# EAGLE schematic waveform (EAGLE 9.6.2)
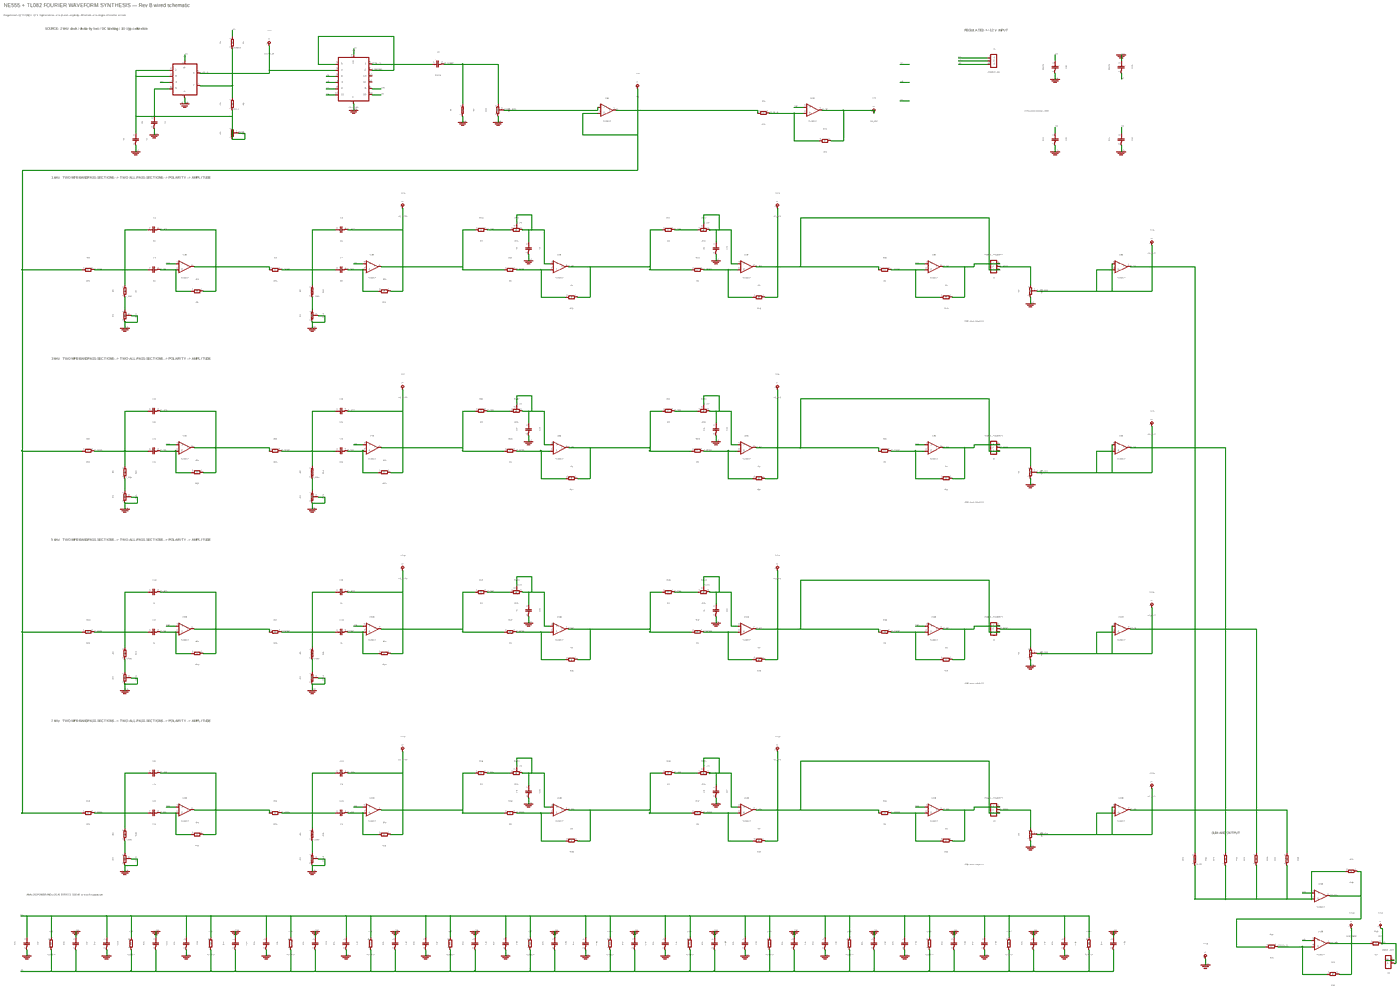
[diagram p0: schematic, sheet 1, overview]
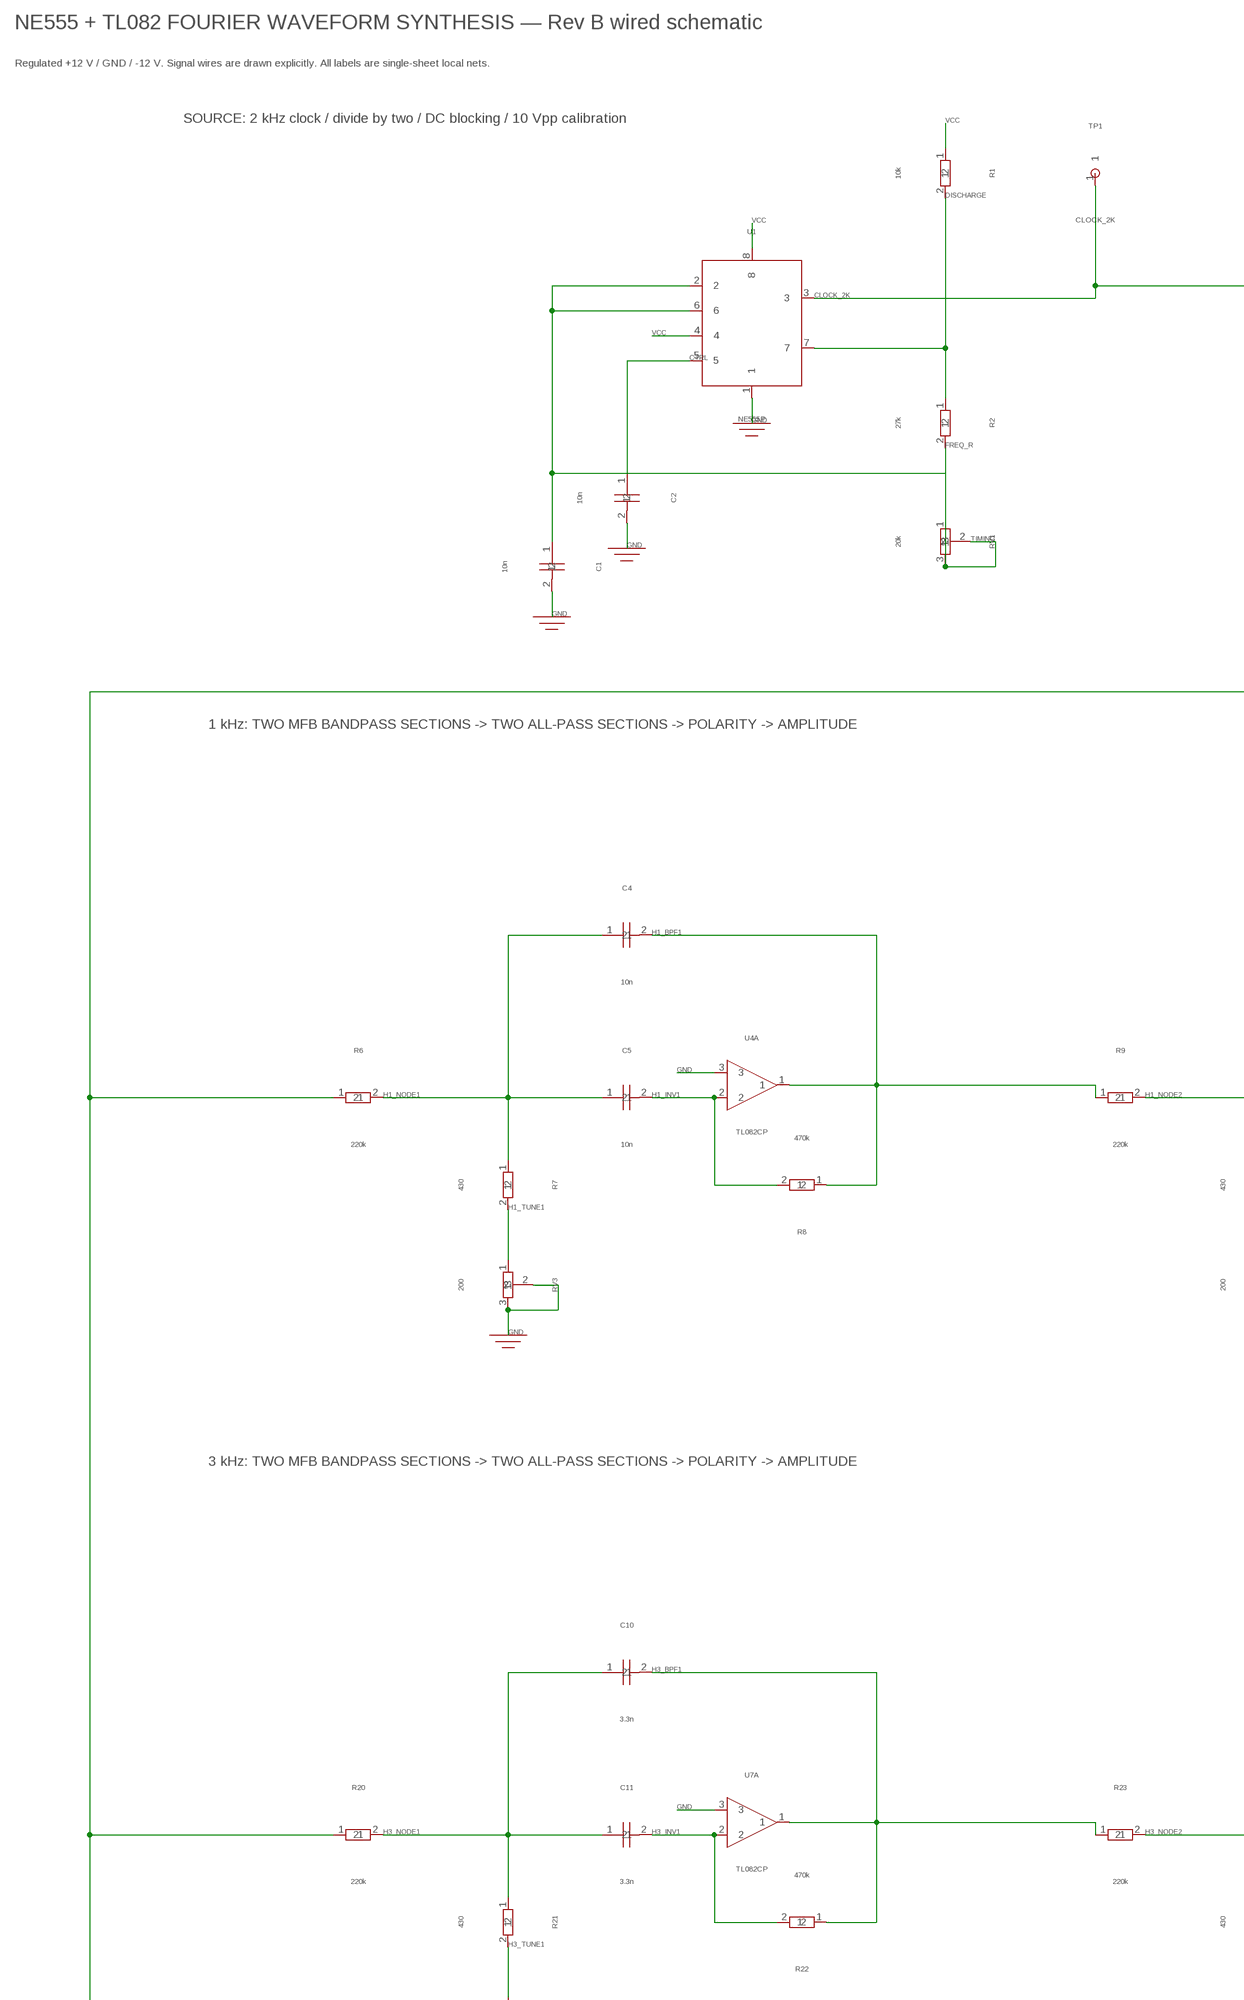
[diagram p1: schematic, sheet 1, part 1 of 8]
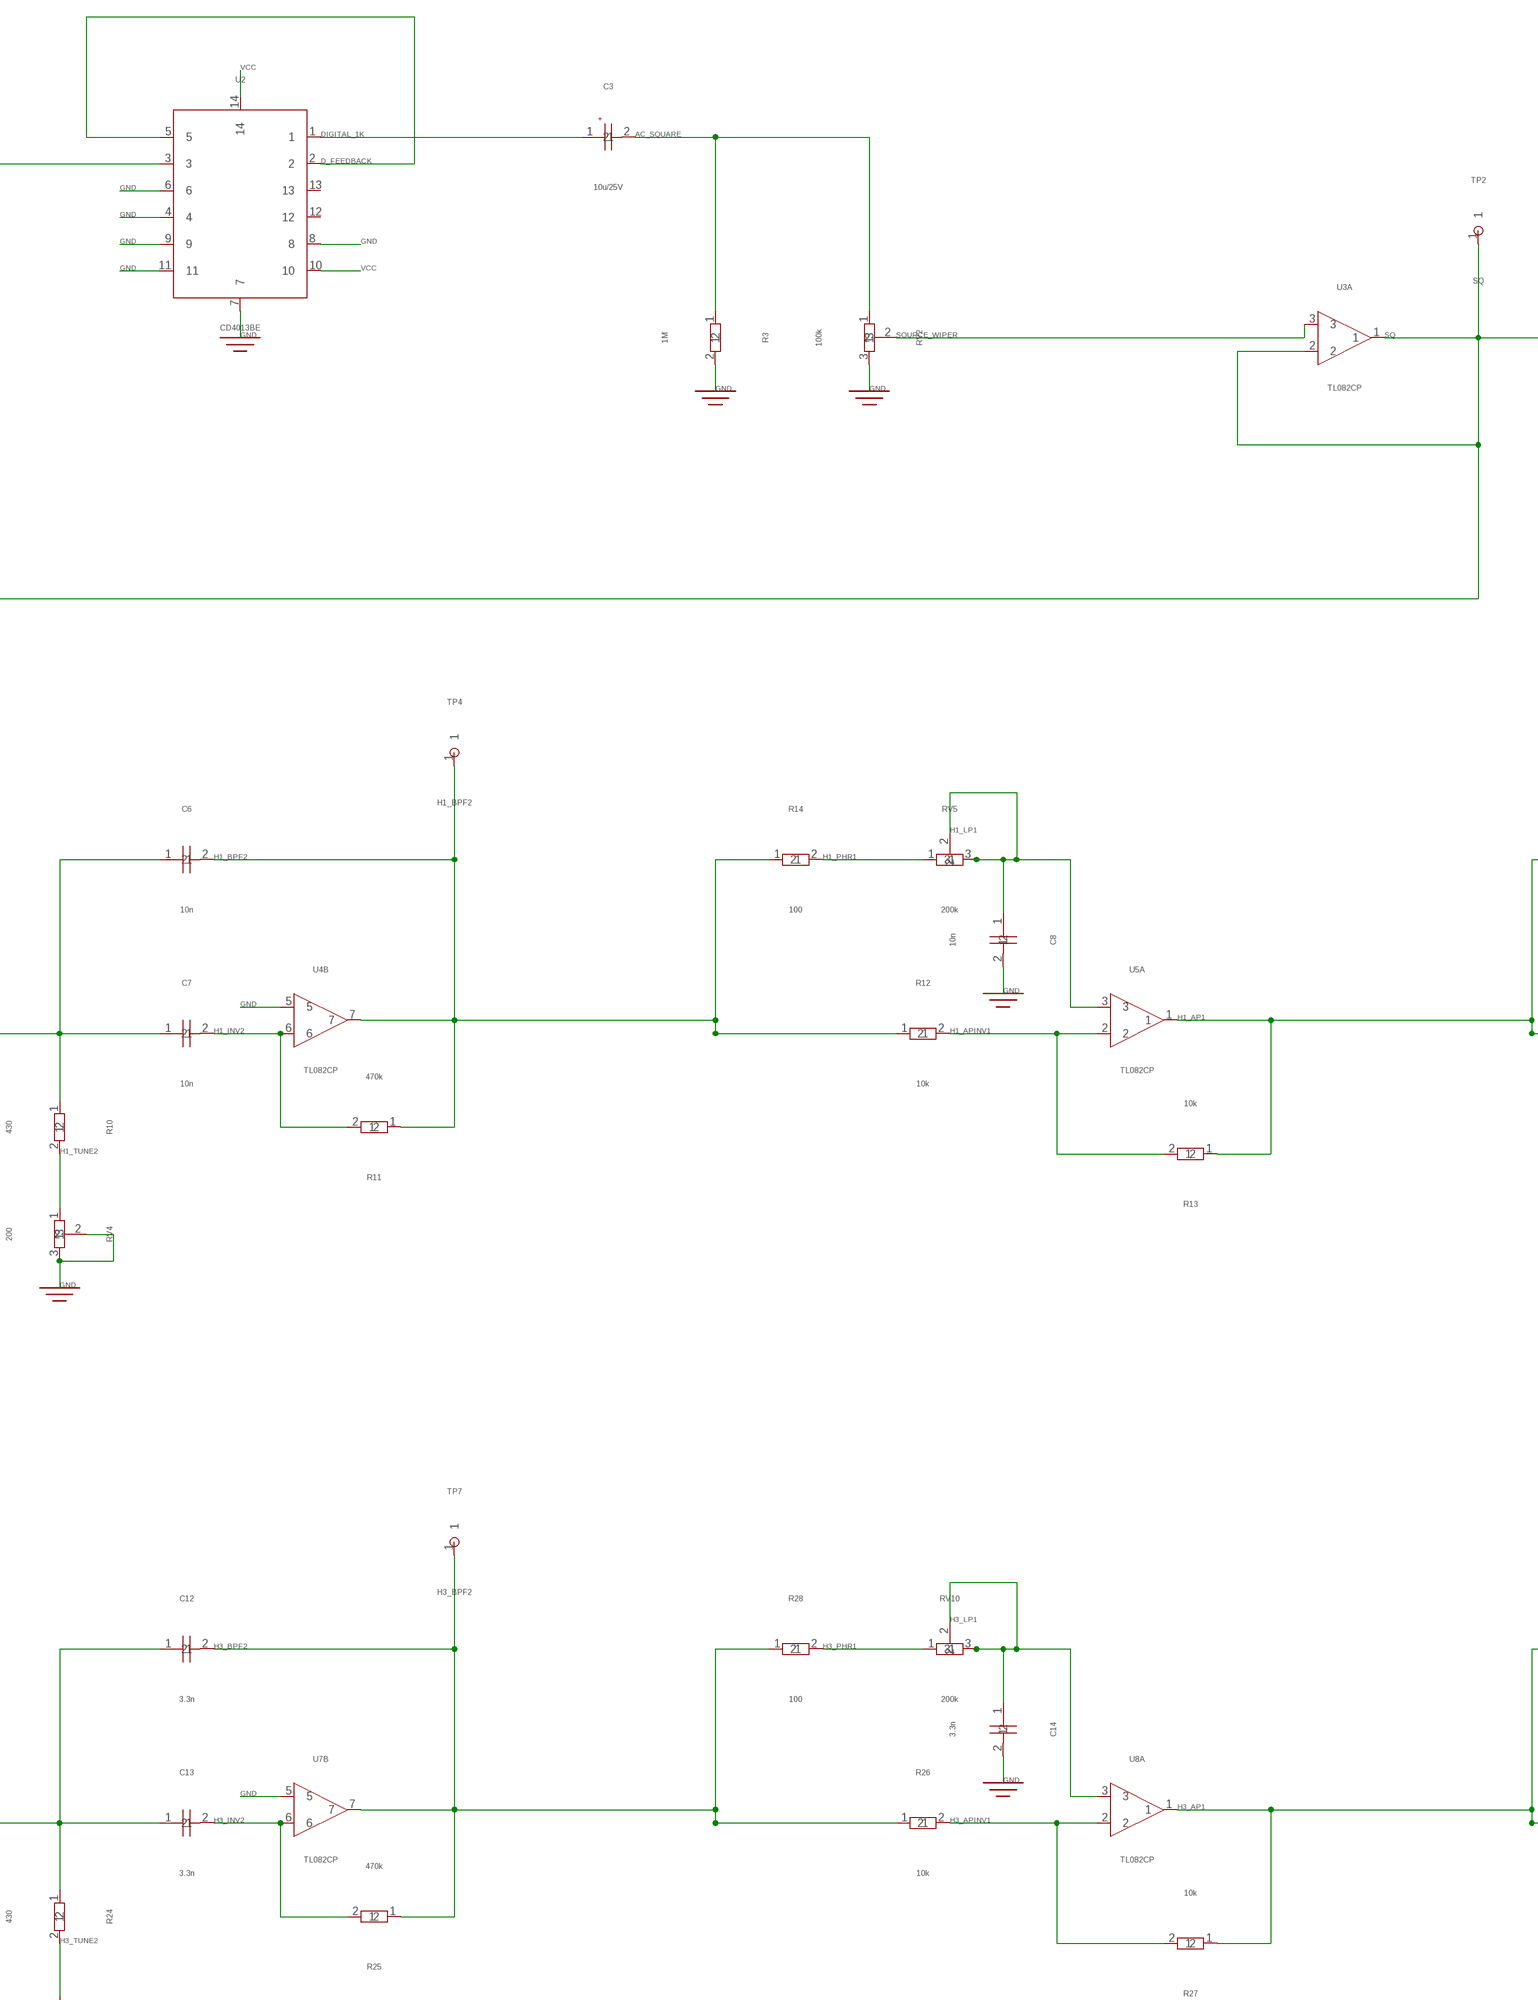
[diagram p2: schematic, sheet 1, part 2 of 8]
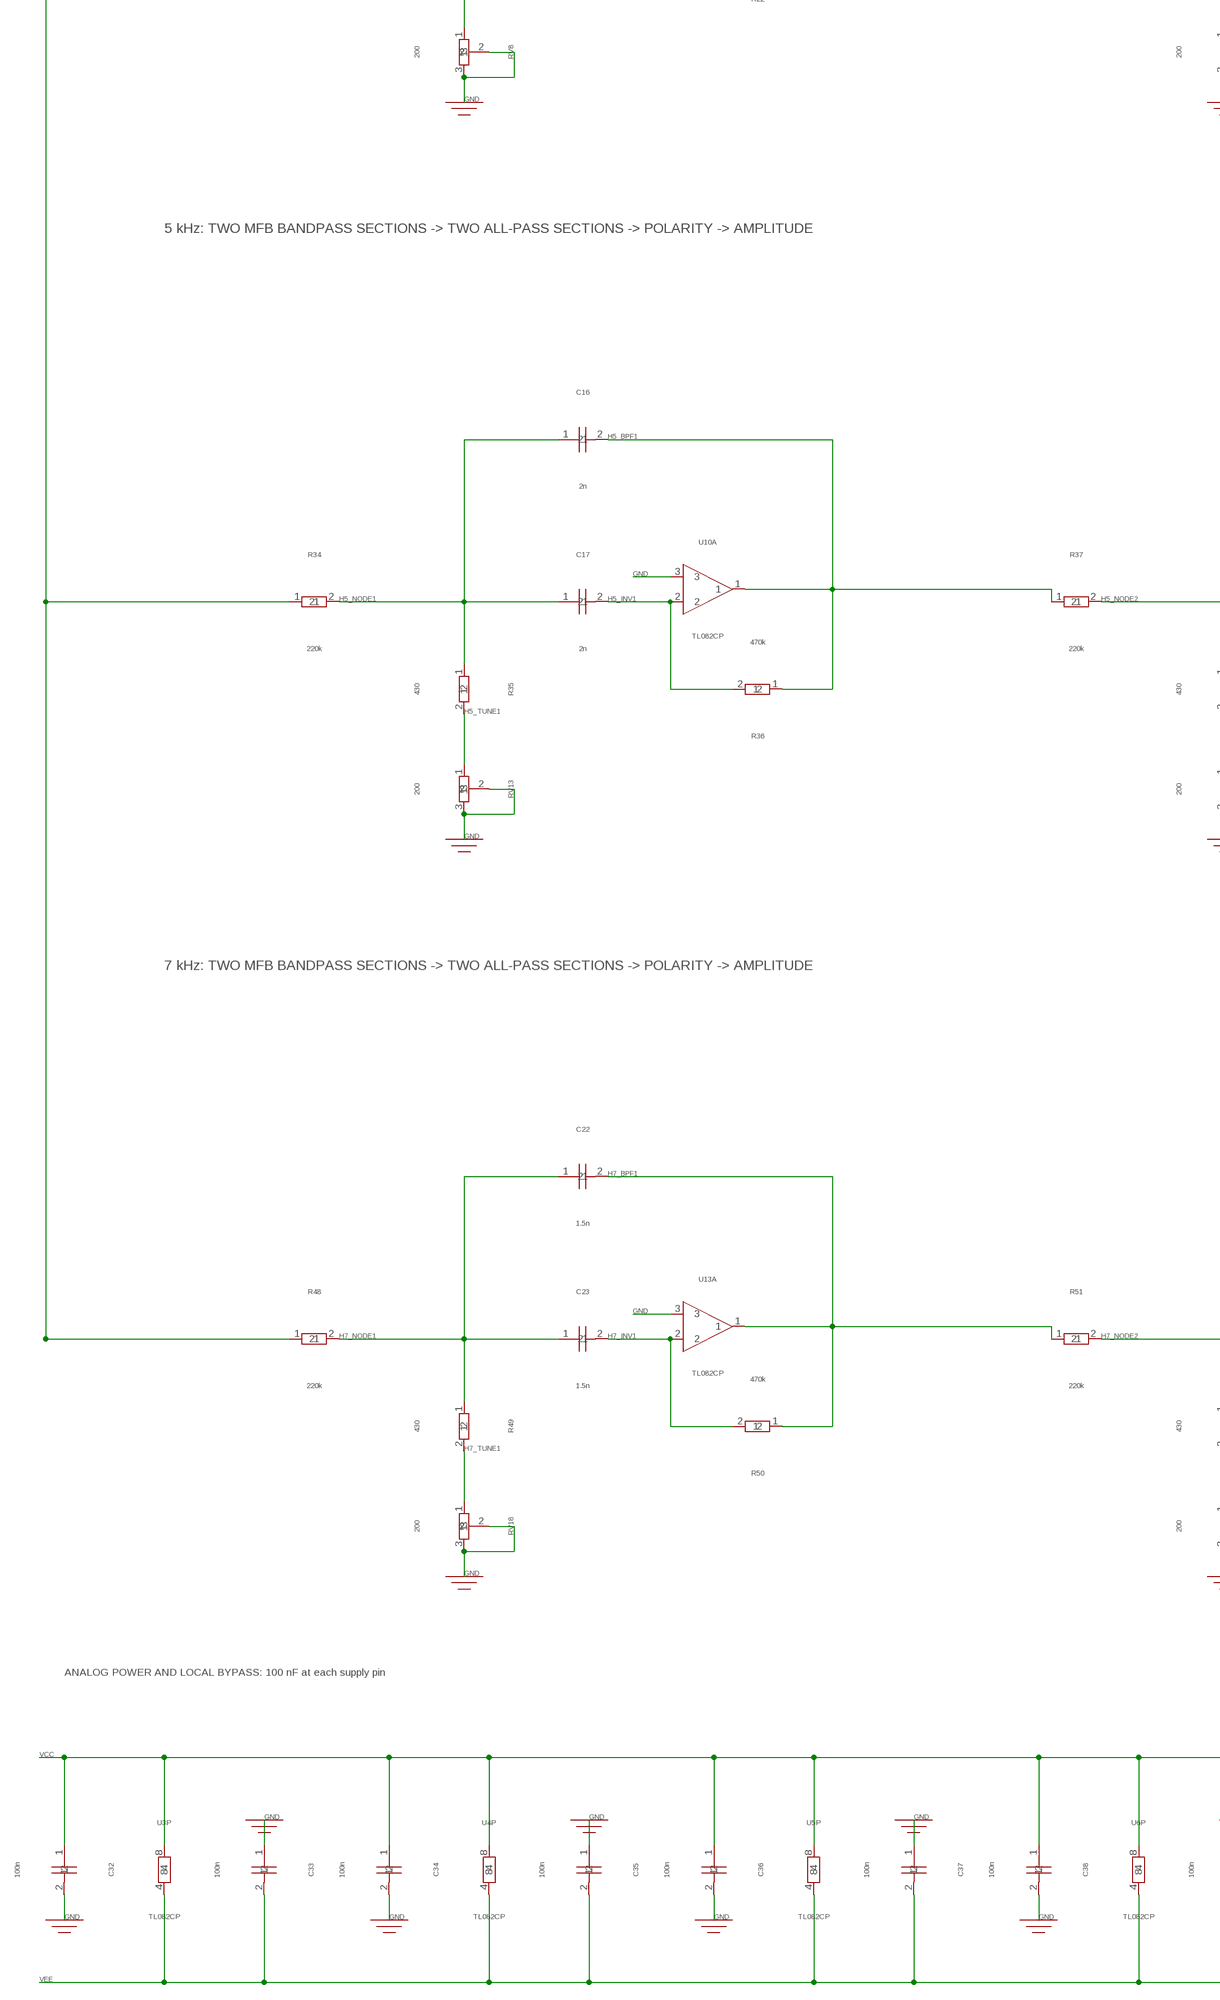
[diagram p3: schematic, sheet 1, part 3 of 8]
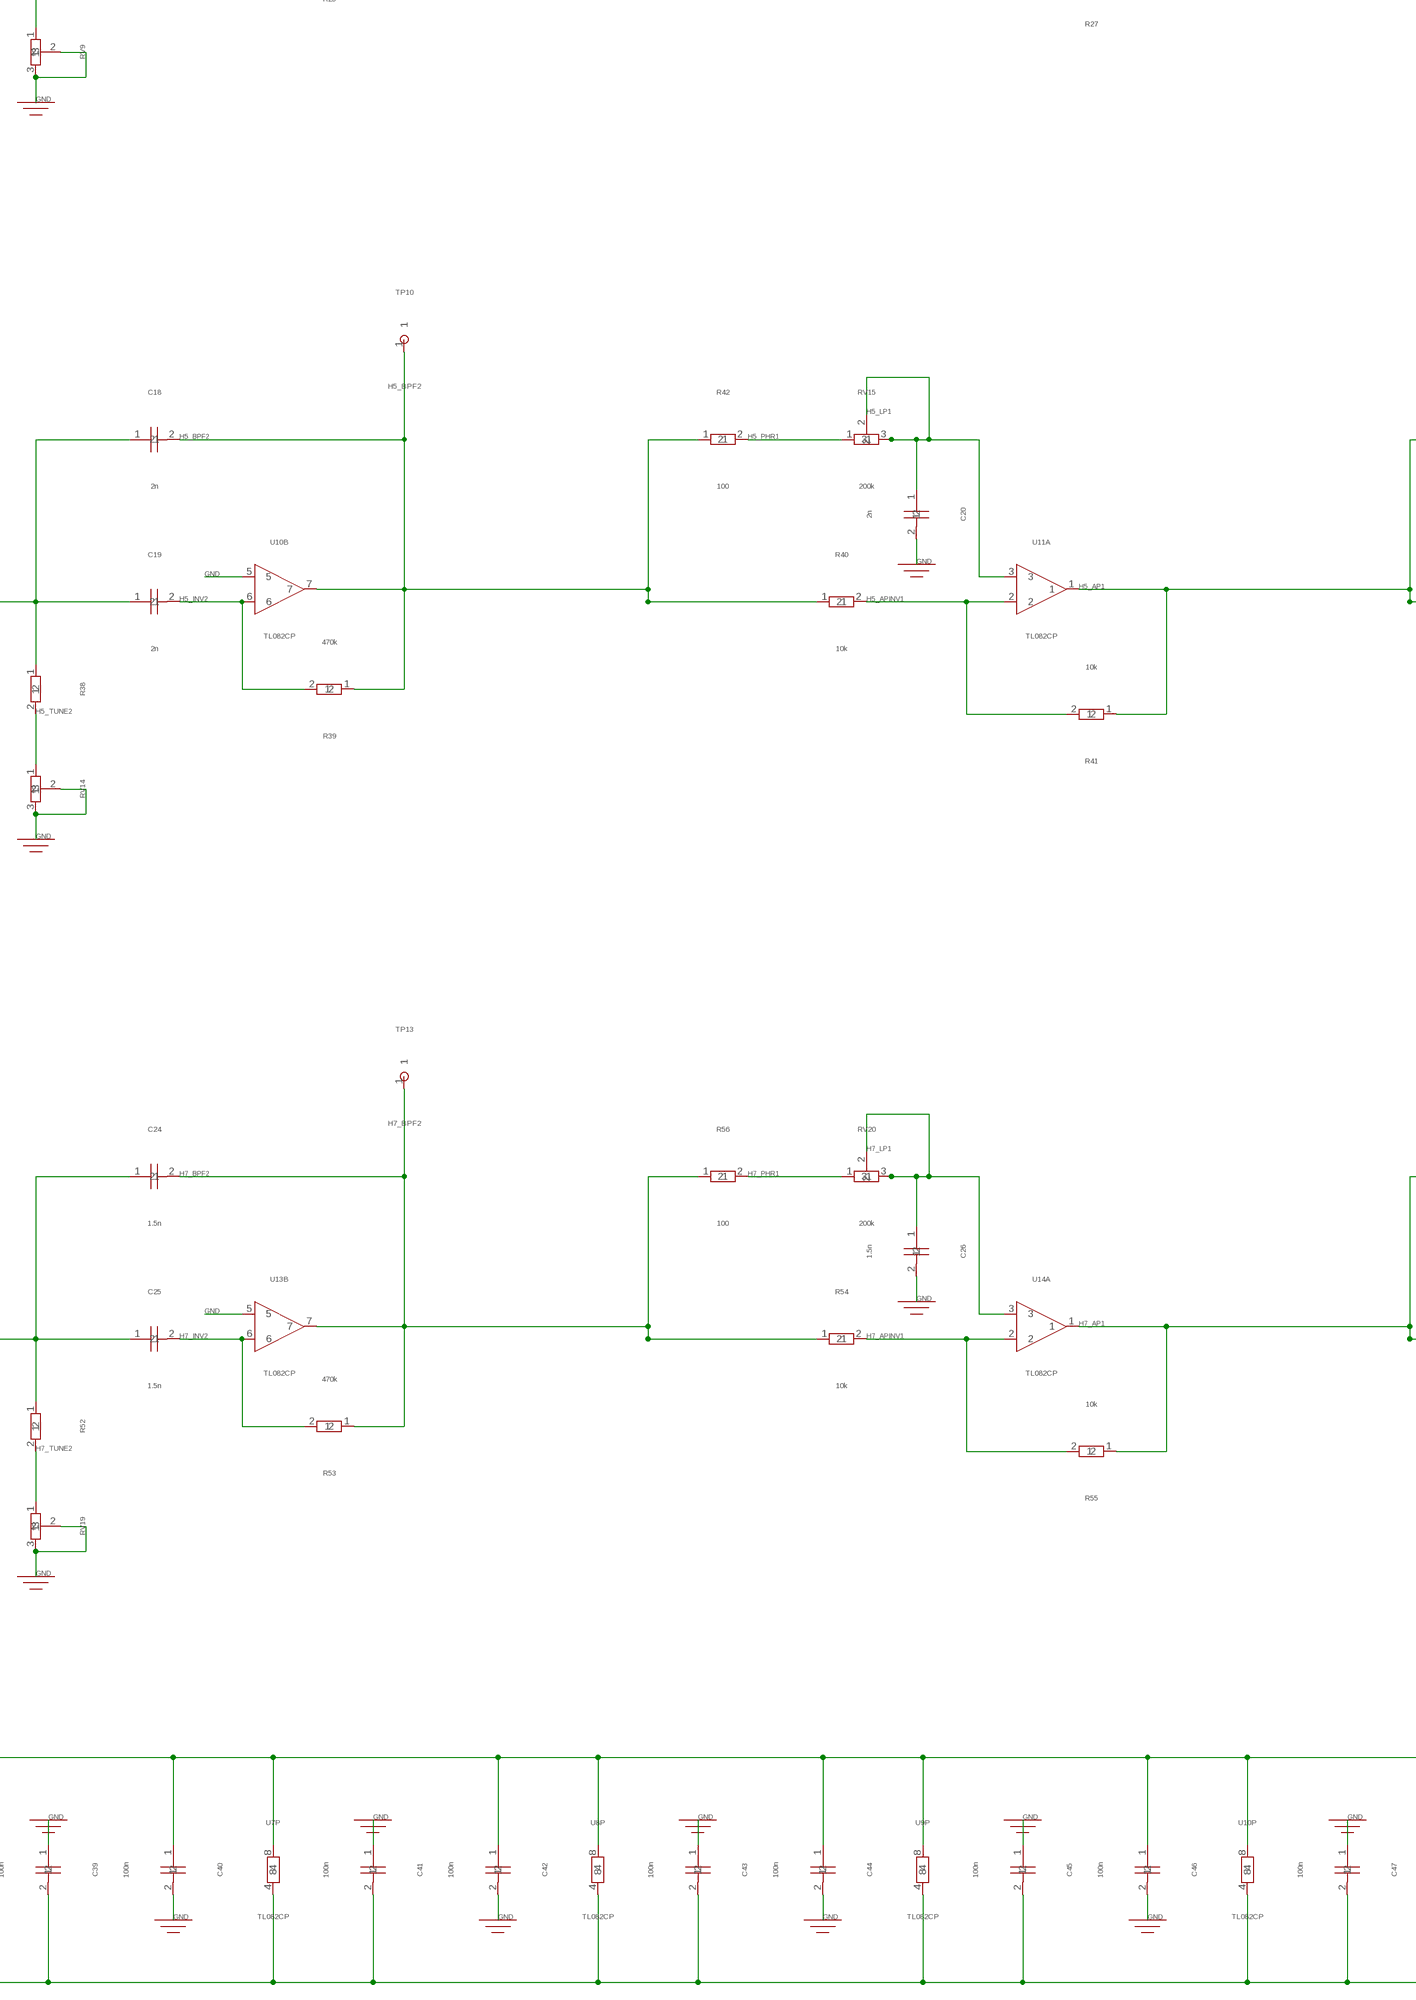
[diagram p4: schematic, sheet 1, part 4 of 8]
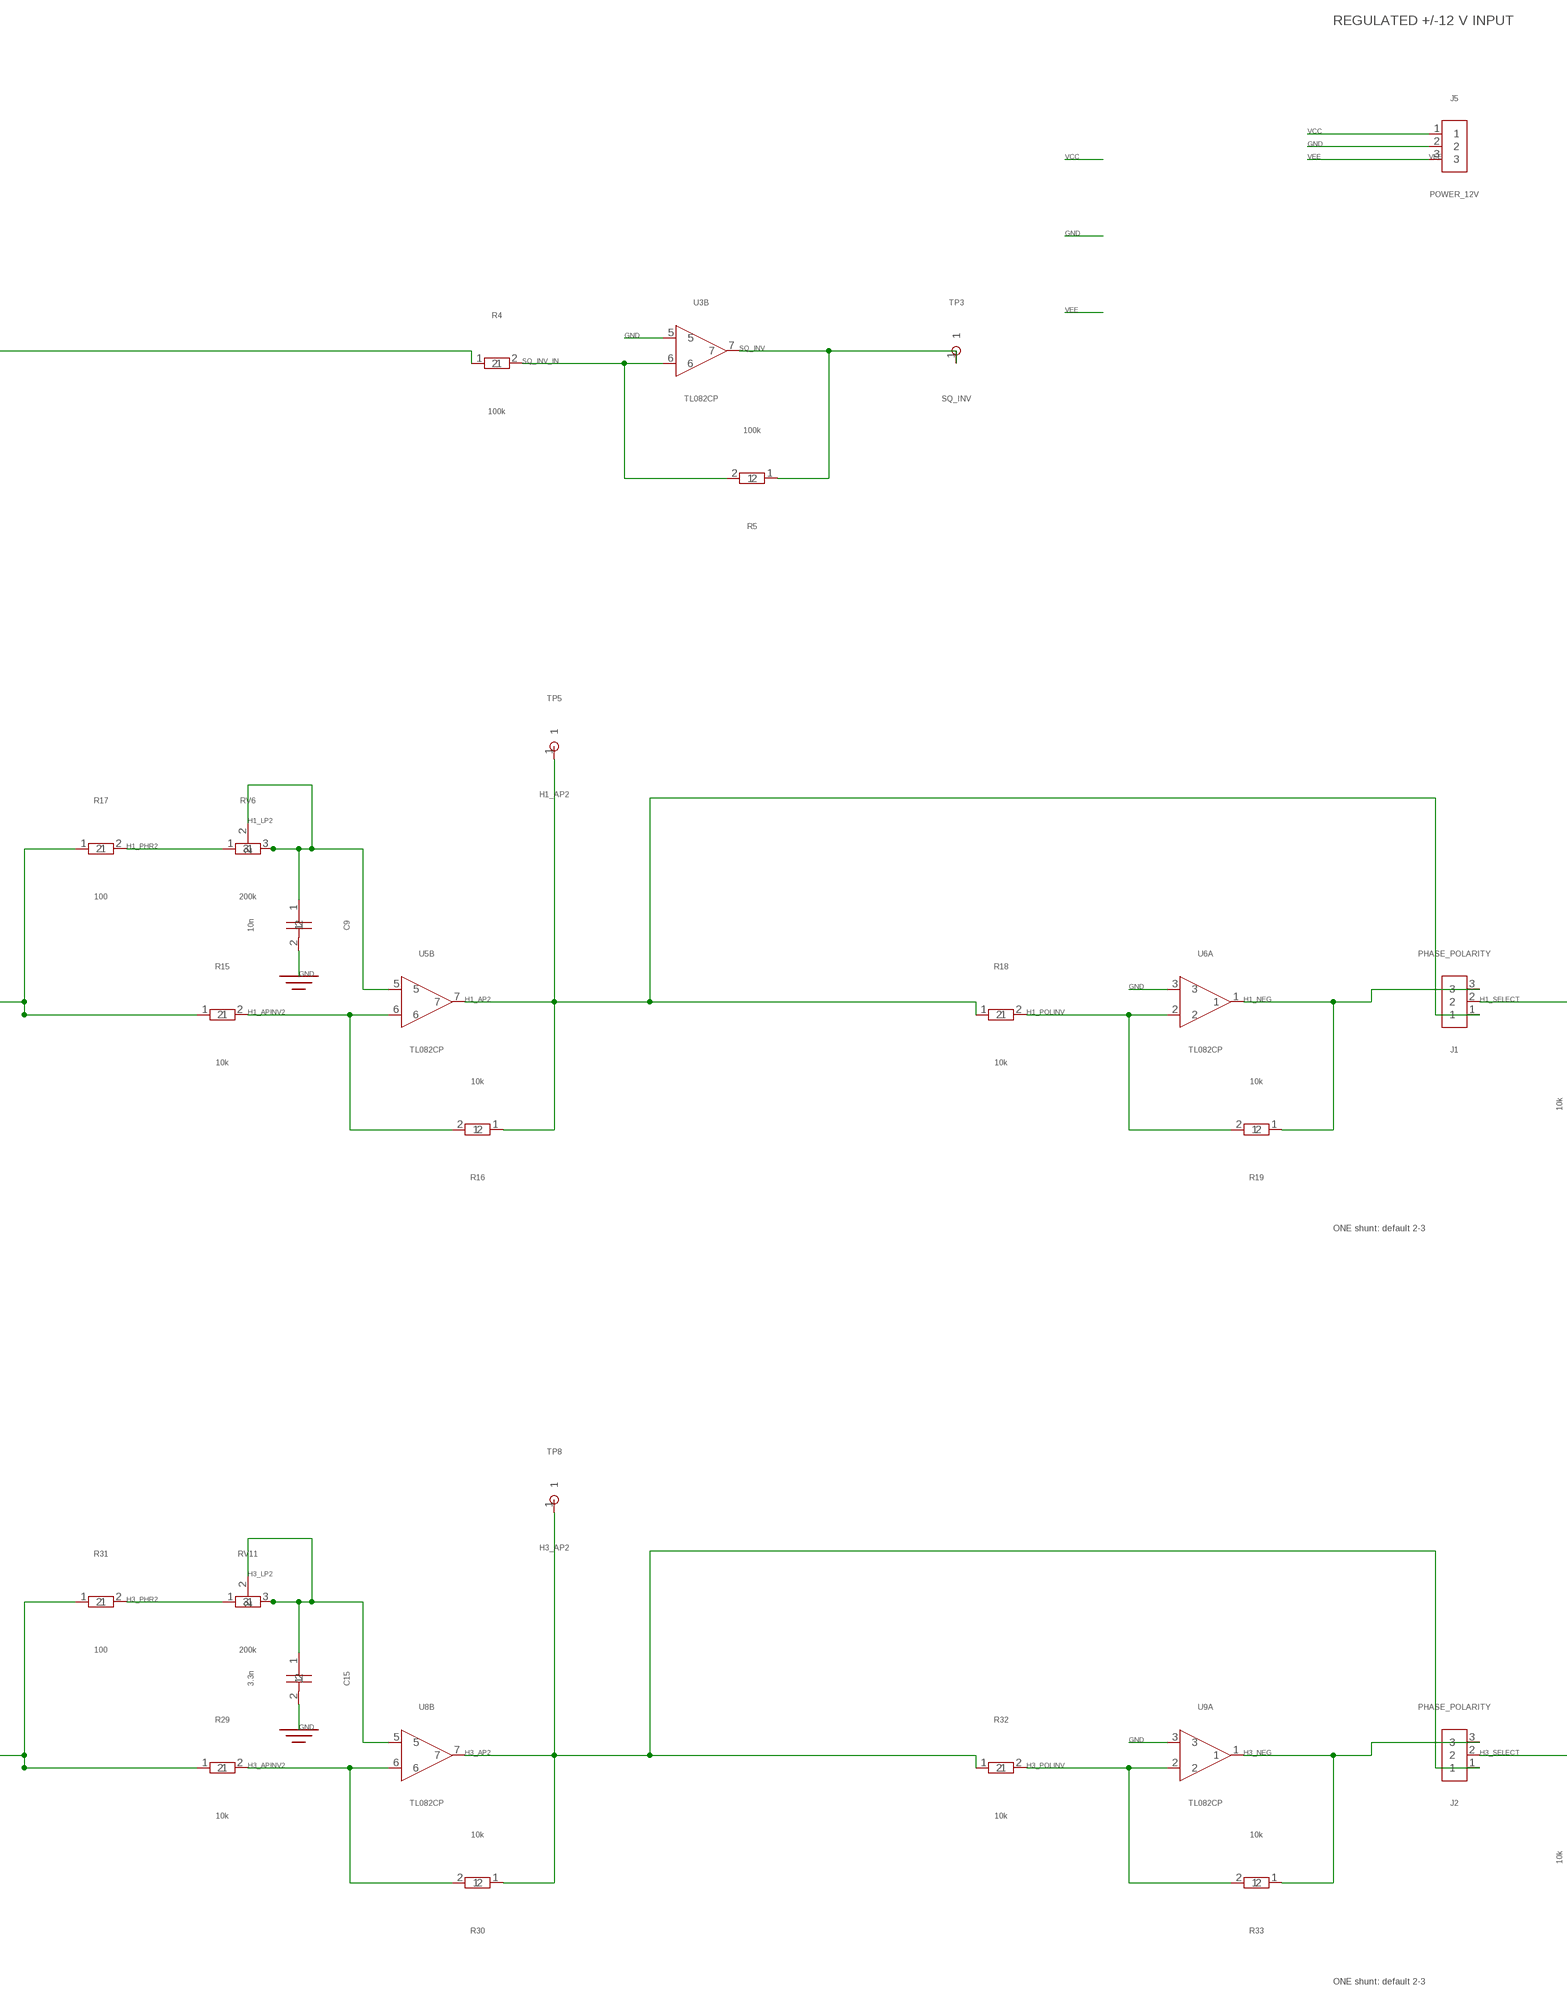
[diagram p5: schematic, sheet 1, part 5 of 8]
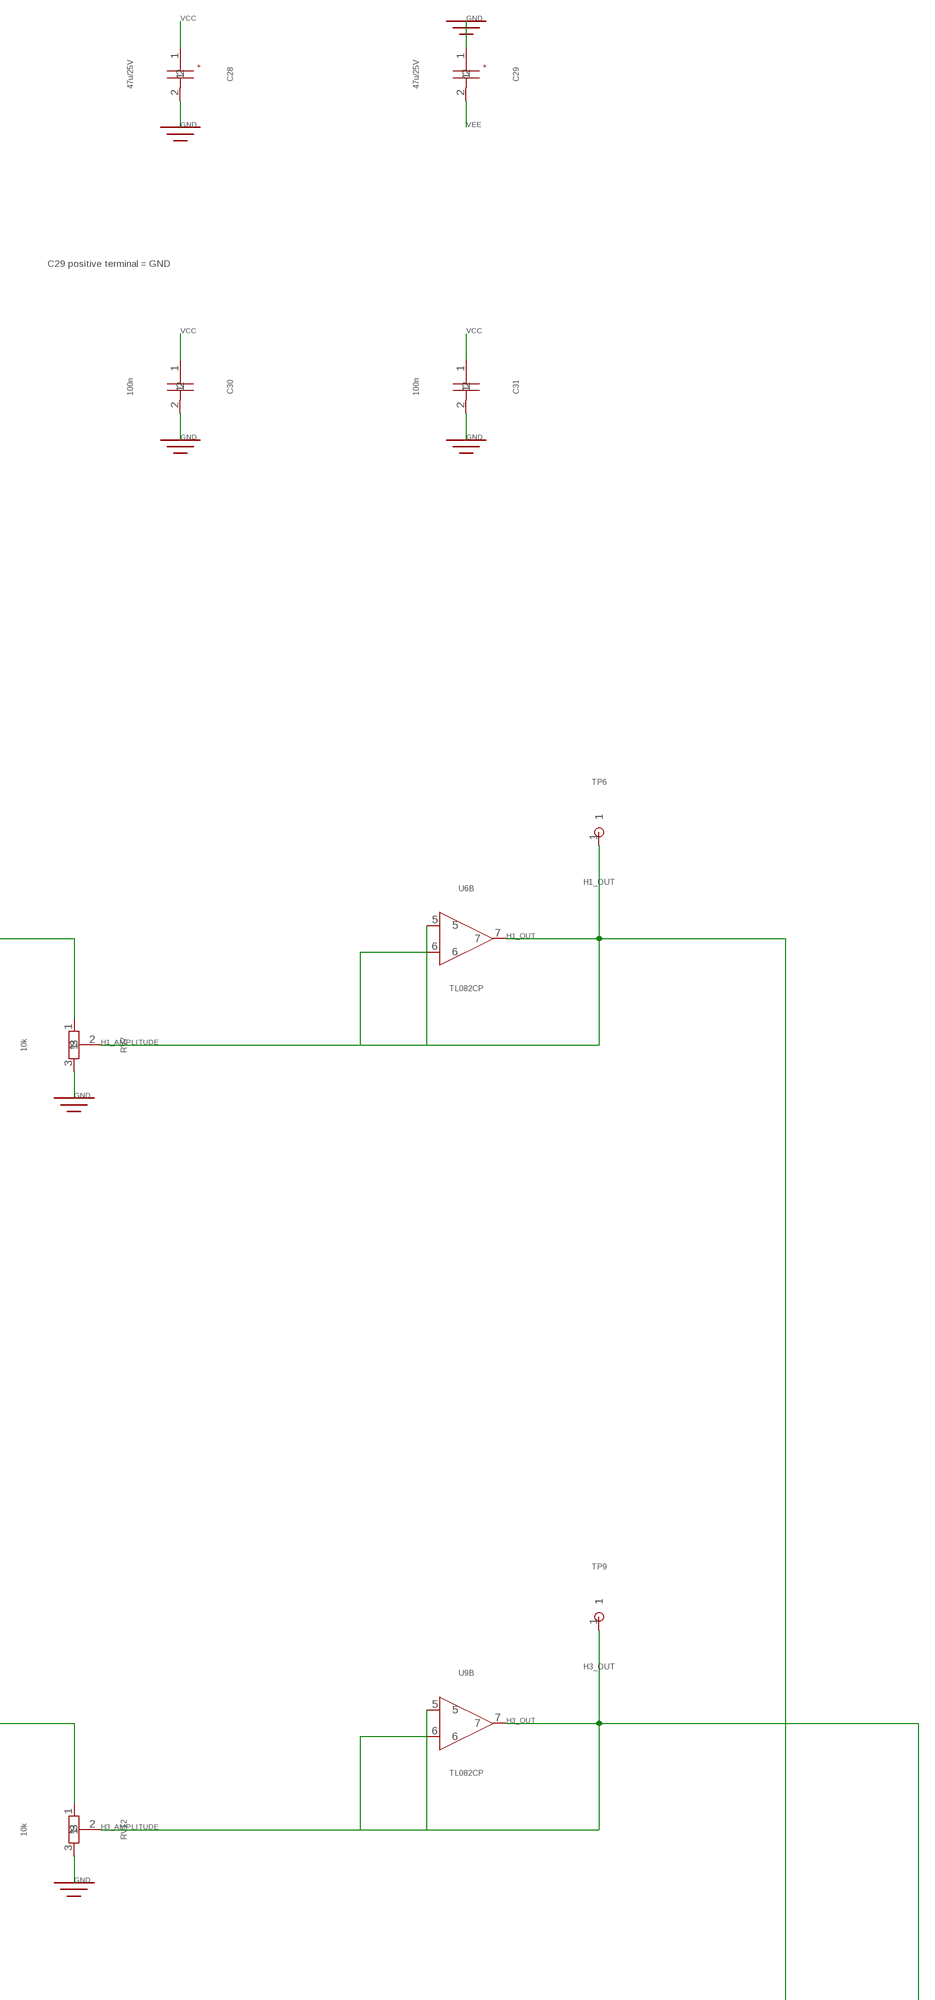
[diagram p6: schematic, sheet 1, part 6 of 8]
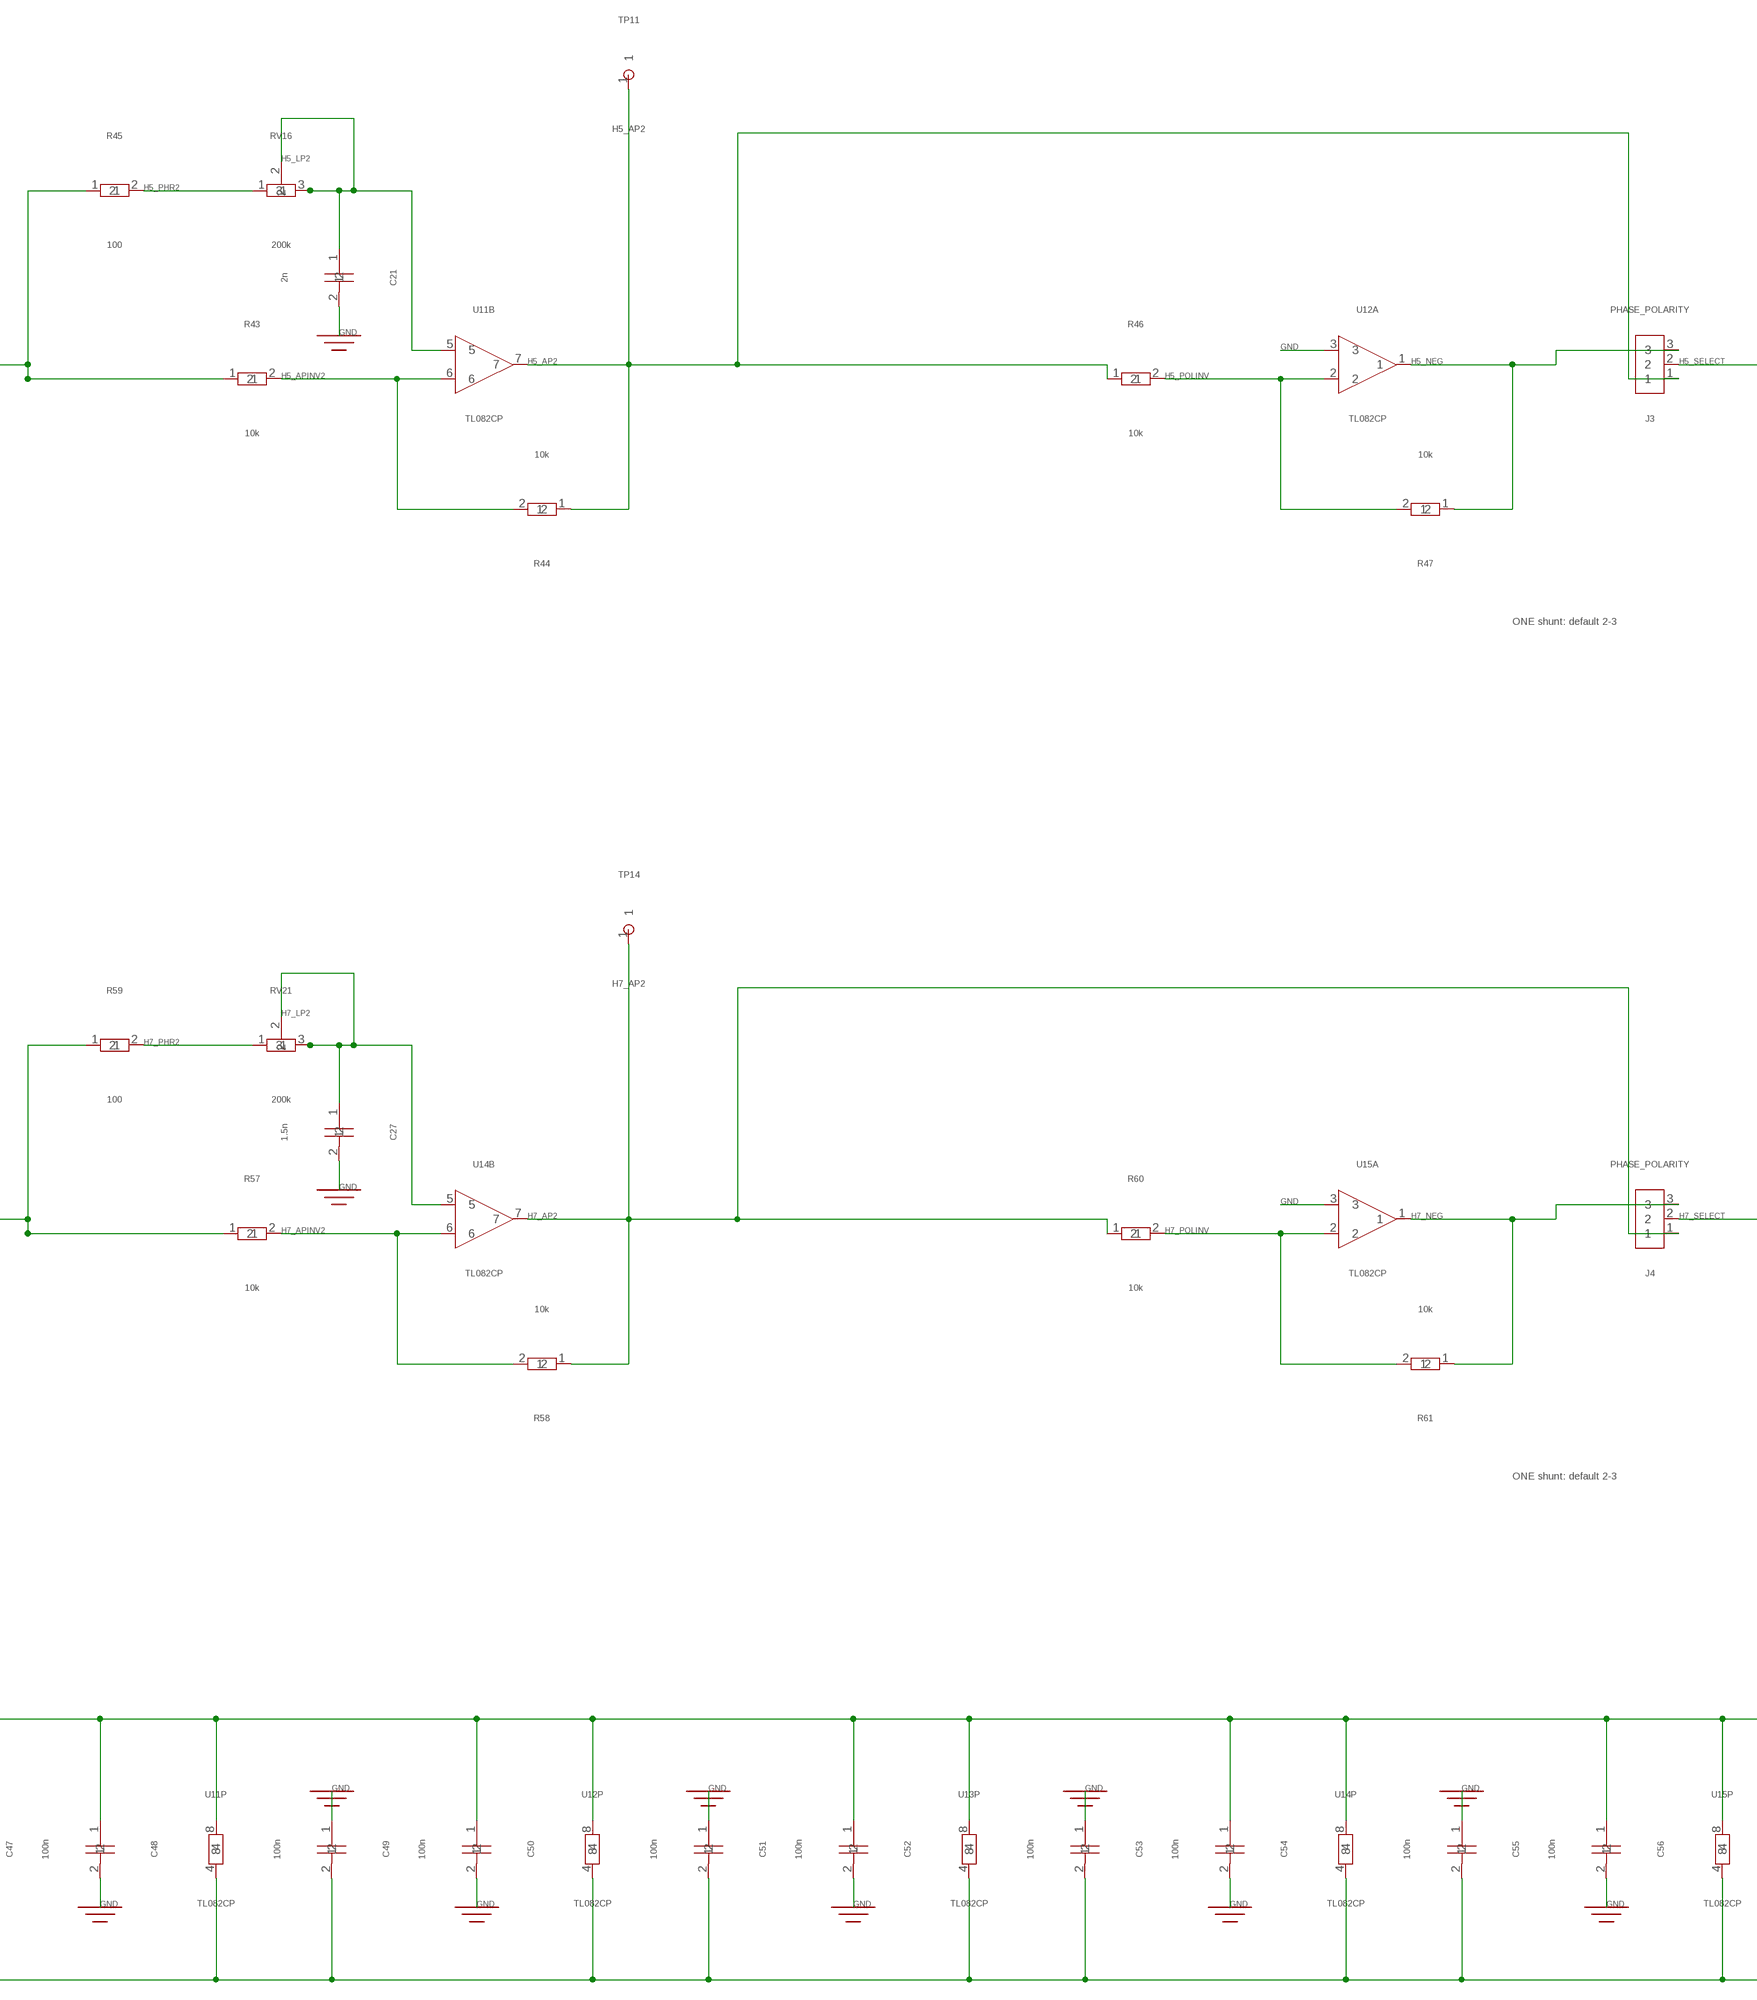
[diagram p7: schematic, sheet 1, part 7 of 8]
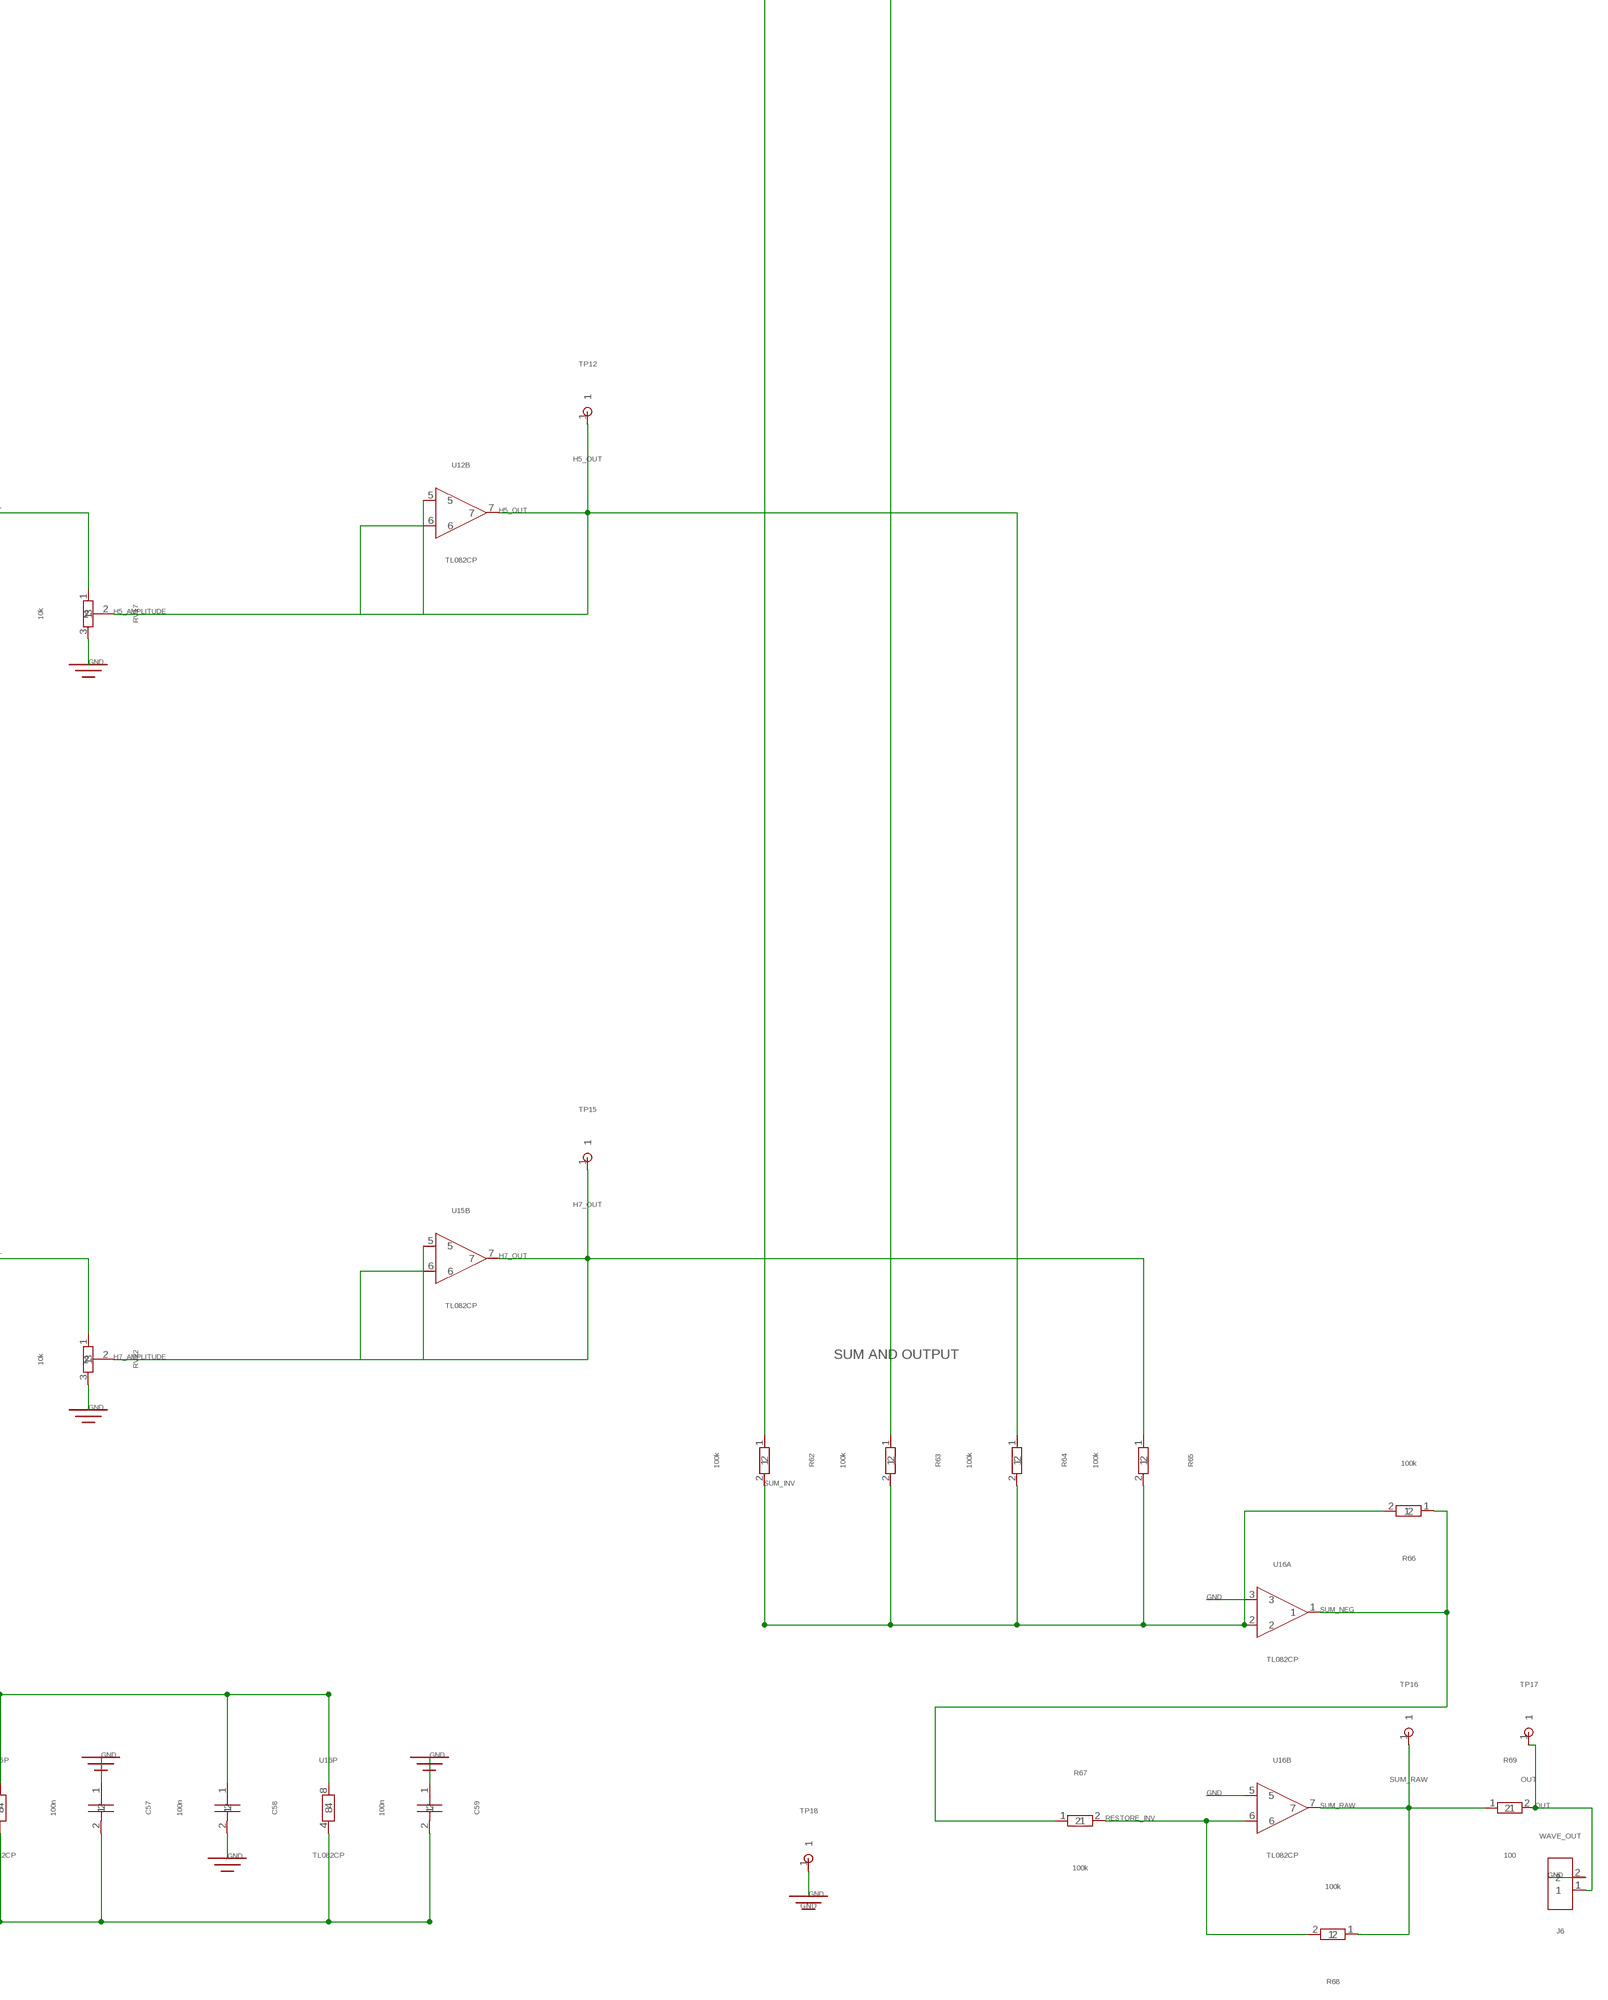
[diagram p8: schematic, sheet 1, part 8 of 8]

## Parts
C1  10n  C  [C_Disc_D5.0mm_W2.5mm_P5.00mm]
C2  10n  C  [C_Disc_D5.0mm_W2.5mm_P5.00mm]
C3  10u/25V  CP  [CP_Radial_D5.0mm_P2.00mm]
C4  10n  C  [C_Disc_D5.0mm_W2.5mm_P5.00mm]
C5  10n  C  [C_Disc_D5.0mm_W2.5mm_P5.00mm]
C6  10n  C  [C_Disc_D5.0mm_W2.5mm_P5.00mm]
C7  10n  C  [C_Disc_D5.0mm_W2.5mm_P5.00mm]
C8  10n  C  [C_Disc_D5.0mm_W2.5mm_P5.00mm]
C9  10n  C  [C_Disc_D5.0mm_W2.5mm_P5.00mm]
C10  3.3n  C  [C_Disc_D5.0mm_W2.5mm_P5.00mm]
C11  3.3n  C  [C_Disc_D5.0mm_W2.5mm_P5.00mm]
C12  3.3n  C  [C_Disc_D5.0mm_W2.5mm_P5.00mm]
C13  3.3n  C  [C_Disc_D5.0mm_W2.5mm_P5.00mm]
C14  3.3n  C  [C_Disc_D5.0mm_W2.5mm_P5.00mm]
C15  3.3n  C  [C_Disc_D5.0mm_W2.5mm_P5.00mm]
C16  2n  C  [C_Disc_D5.0mm_W2.5mm_P5.00mm]
C17  2n  C  [C_Disc_D5.0mm_W2.5mm_P5.00mm]
C18  2n  C  [C_Disc_D5.0mm_W2.5mm_P5.00mm]
C19  2n  C  [C_Disc_D5.0mm_W2.5mm_P5.00mm]
C20  2n  C  [C_Disc_D5.0mm_W2.5mm_P5.00mm]
C21  2n  C  [C_Disc_D5.0mm_W2.5mm_P5.00mm]
C22  1.5n  C  [C_Disc_D5.0mm_W2.5mm_P5.00mm]
C23  1.5n  C  [C_Disc_D5.0mm_W2.5mm_P5.00mm]
C24  1.5n  C  [C_Disc_D5.0mm_W2.5mm_P5.00mm]
C25  1.5n  C  [C_Disc_D5.0mm_W2.5mm_P5.00mm]
C26  1.5n  C  [C_Disc_D5.0mm_W2.5mm_P5.00mm]
C27  1.5n  C  [C_Disc_D5.0mm_W2.5mm_P5.00mm]
C28  47u/25V  CP  [CP_Radial_D5.0mm_P2.00mm]
C29  47u/25V  CP  [CP_Radial_D5.0mm_P2.00mm]
C30  100n  C  [C_Disc_D5.0mm_W2.5mm_P5.00mm]
C31  100n  C  [C_Disc_D5.0mm_W2.5mm_P5.00mm]
C32  100n  C  [C_Disc_D5.0mm_W2.5mm_P5.00mm]
C33  100n  C  [C_Disc_D5.0mm_W2.5mm_P5.00mm]
C34  100n  C  [C_Disc_D5.0mm_W2.5mm_P5.00mm]
C35  100n  C  [C_Disc_D5.0mm_W2.5mm_P5.00mm]
C36  100n  C  [C_Disc_D5.0mm_W2.5mm_P5.00mm]
C37  100n  C  [C_Disc_D5.0mm_W2.5mm_P5.00mm]
C38  100n  C  [C_Disc_D5.0mm_W2.5mm_P5.00mm]
C39  100n  C  [C_Disc_D5.0mm_W2.5mm_P5.00mm]
C40  100n  C  [C_Disc_D5.0mm_W2.5mm_P5.00mm]
C41  100n  C  [C_Disc_D5.0mm_W2.5mm_P5.00mm]
C42  100n  C  [C_Disc_D5.0mm_W2.5mm_P5.00mm]
C43  100n  C  [C_Disc_D5.0mm_W2.5mm_P5.00mm]
C44  100n  C  [C_Disc_D5.0mm_W2.5mm_P5.00mm]
C45  100n  C  [C_Disc_D5.0mm_W2.5mm_P5.00mm]
C46  100n  C  [C_Disc_D5.0mm_W2.5mm_P5.00mm]
C47  100n  C  [C_Disc_D5.0mm_W2.5mm_P5.00mm]
C48  100n  C  [C_Disc_D5.0mm_W2.5mm_P5.00mm]
C49  100n  C  [C_Disc_D5.0mm_W2.5mm_P5.00mm]
C50  100n  C  [C_Disc_D5.0mm_W2.5mm_P5.00mm]
C51  100n  C  [C_Disc_D5.0mm_W2.5mm_P5.00mm]
C52  100n  C  [C_Disc_D5.0mm_W2.5mm_P5.00mm]
C53  100n  C  [C_Disc_D5.0mm_W2.5mm_P5.00mm]
C54  100n  C  [C_Disc_D5.0mm_W2.5mm_P5.00mm]
C55  100n  C  [C_Disc_D5.0mm_W2.5mm_P5.00mm]
C56  100n  C  [C_Disc_D5.0mm_W2.5mm_P5.00mm]
C57  100n  C  [C_Disc_D5.0mm_W2.5mm_P5.00mm]
C58  100n  C  [C_Disc_D5.0mm_W2.5mm_P5.00mm]
C59  100n  C  [C_Disc_D5.0mm_W2.5mm_P5.00mm]
J1  PHASE_POLARITY  CONN3  [PinHeader_1x03_P2.54mm_Vertical]
J2  PHASE_POLARITY  CONN3  [PinHeader_1x03_P2.54mm_Vertical]
J3  PHASE_POLARITY  CONN3  [PinHeader_1x03_P2.54mm_Vertical]
J4  PHASE_POLARITY  CONN3  [PinHeader_1x03_P2.54mm_Vertical]
J5  POWER_12V  CONN3  [PinHeader_1x03_P2.54mm_Vertical]
J6  WAVE_OUT  CONN2  [PinHeader_1x02_P2.54mm_Vertical]
R1  10k  R  [R_Axial_DIN0207_L6.3mm_D2.5mm_P7.62mm_Horizontal]
R2  27k  R  [R_Axial_DIN0207_L6.3mm_D2.5mm_P7.62mm_Horizontal]
R3  1M  R  [R_Axial_DIN0207_L6.3mm_D2.5mm_P7.62mm_Horizontal]
R4  100k  R  [R_Axial_DIN0207_L6.3mm_D2.5mm_P7.62mm_Horizontal]
R5  100k  R  [R_Axial_DIN0207_L6.3mm_D2.5mm_P7.62mm_Horizontal]
R6  220k  R  [R_Axial_DIN0207_L6.3mm_D2.5mm_P7.62mm_Horizontal]
R7  430  R  [R_Axial_DIN0207_L6.3mm_D2.5mm_P7.62mm_Horizontal]
R8  470k  R  [R_Axial_DIN0207_L6.3mm_D2.5mm_P7.62mm_Horizontal]
R9  220k  R  [R_Axial_DIN0207_L6.3mm_D2.5mm_P7.62mm_Horizontal]
R10  430  R  [R_Axial_DIN0207_L6.3mm_D2.5mm_P7.62mm_Horizontal]
R11  470k  R  [R_Axial_DIN0207_L6.3mm_D2.5mm_P7.62mm_Horizontal]
R12  10k  R  [R_Axial_DIN0207_L6.3mm_D2.5mm_P7.62mm_Horizontal]
R13  10k  R  [R_Axial_DIN0207_L6.3mm_D2.5mm_P7.62mm_Horizontal]
R14  100  R  [R_Axial_DIN0207_L6.3mm_D2.5mm_P7.62mm_Horizontal]
R15  10k  R  [R_Axial_DIN0207_L6.3mm_D2.5mm_P7.62mm_Horizontal]
R16  10k  R  [R_Axial_DIN0207_L6.3mm_D2.5mm_P7.62mm_Horizontal]
R17  100  R  [R_Axial_DIN0207_L6.3mm_D2.5mm_P7.62mm_Horizontal]
R18  10k  R  [R_Axial_DIN0207_L6.3mm_D2.5mm_P7.62mm_Horizontal]
R19  10k  R  [R_Axial_DIN0207_L6.3mm_D2.5mm_P7.62mm_Horizontal]
R20  220k  R  [R_Axial_DIN0207_L6.3mm_D2.5mm_P7.62mm_Horizontal]
R21  430  R  [R_Axial_DIN0207_L6.3mm_D2.5mm_P7.62mm_Horizontal]
R22  470k  R  [R_Axial_DIN0207_L6.3mm_D2.5mm_P7.62mm_Horizontal]
R23  220k  R  [R_Axial_DIN0207_L6.3mm_D2.5mm_P7.62mm_Horizontal]
R24  430  R  [R_Axial_DIN0207_L6.3mm_D2.5mm_P7.62mm_Horizontal]
R25  470k  R  [R_Axial_DIN0207_L6.3mm_D2.5mm_P7.62mm_Horizontal]
R26  10k  R  [R_Axial_DIN0207_L6.3mm_D2.5mm_P7.62mm_Horizontal]
R27  10k  R  [R_Axial_DIN0207_L6.3mm_D2.5mm_P7.62mm_Horizontal]
R28  100  R  [R_Axial_DIN0207_L6.3mm_D2.5mm_P7.62mm_Horizontal]
R29  10k  R  [R_Axial_DIN0207_L6.3mm_D2.5mm_P7.62mm_Horizontal]
R30  10k  R  [R_Axial_DIN0207_L6.3mm_D2.5mm_P7.62mm_Horizontal]
R31  100  R  [R_Axial_DIN0207_L6.3mm_D2.5mm_P7.62mm_Horizontal]
R32  10k  R  [R_Axial_DIN0207_L6.3mm_D2.5mm_P7.62mm_Horizontal]
R33  10k  R  [R_Axial_DIN0207_L6.3mm_D2.5mm_P7.62mm_Horizontal]
R34  220k  R  [R_Axial_DIN0207_L6.3mm_D2.5mm_P7.62mm_Horizontal]
R35  430  R  [R_Axial_DIN0207_L6.3mm_D2.5mm_P7.62mm_Horizontal]
R36  470k  R  [R_Axial_DIN0207_L6.3mm_D2.5mm_P7.62mm_Horizontal]
R37  220k  R  [R_Axial_DIN0207_L6.3mm_D2.5mm_P7.62mm_Horizontal]
R38  430  R  [R_Axial_DIN0207_L6.3mm_D2.5mm_P7.62mm_Horizontal]
R39  470k  R  [R_Axial_DIN0207_L6.3mm_D2.5mm_P7.62mm_Horizontal]
R40  10k  R  [R_Axial_DIN0207_L6.3mm_D2.5mm_P7.62mm_Horizontal]
R41  10k  R  [R_Axial_DIN0207_L6.3mm_D2.5mm_P7.62mm_Horizontal]
R42  100  R  [R_Axial_DIN0207_L6.3mm_D2.5mm_P7.62mm_Horizontal]
R43  10k  R  [R_Axial_DIN0207_L6.3mm_D2.5mm_P7.62mm_Horizontal]
R44  10k  R  [R_Axial_DIN0207_L6.3mm_D2.5mm_P7.62mm_Horizontal]
R45  100  R  [R_Axial_DIN0207_L6.3mm_D2.5mm_P7.62mm_Horizontal]
R46  10k  R  [R_Axial_DIN0207_L6.3mm_D2.5mm_P7.62mm_Horizontal]
R47  10k  R  [R_Axial_DIN0207_L6.3mm_D2.5mm_P7.62mm_Horizontal]
R48  220k  R  [R_Axial_DIN0207_L6.3mm_D2.5mm_P7.62mm_Horizontal]
R49  430  R  [R_Axial_DIN0207_L6.3mm_D2.5mm_P7.62mm_Horizontal]
R50  470k  R  [R_Axial_DIN0207_L6.3mm_D2.5mm_P7.62mm_Horizontal]
R51  220k  R  [R_Axial_DIN0207_L6.3mm_D2.5mm_P7.62mm_Horizontal]
R52  430  R  [R_Axial_DIN0207_L6.3mm_D2.5mm_P7.62mm_Horizontal]
R53  470k  R  [R_Axial_DIN0207_L6.3mm_D2.5mm_P7.62mm_Horizontal]
R54  10k  R  [R_Axial_DIN0207_L6.3mm_D2.5mm_P7.62mm_Horizontal]
R55  10k  R  [R_Axial_DIN0207_L6.3mm_D2.5mm_P7.62mm_Horizontal]
R56  100  R  [R_Axial_DIN0207_L6.3mm_D2.5mm_P7.62mm_Horizontal]
R57  10k  R  [R_Axial_DIN0207_L6.3mm_D2.5mm_P7.62mm_Horizontal]
R58  10k  R  [R_Axial_DIN0207_L6.3mm_D2.5mm_P7.62mm_Horizontal]
R59  100  R  [R_Axial_DIN0207_L6.3mm_D2.5mm_P7.62mm_Horizontal]
R60  10k  R  [R_Axial_DIN0207_L6.3mm_D2.5mm_P7.62mm_Horizontal]
R61  10k  R  [R_Axial_DIN0207_L6.3mm_D2.5mm_P7.62mm_Horizontal]
R62  100k  R  [R_Axial_DIN0207_L6.3mm_D2.5mm_P7.62mm_Horizontal]
R63  100k  R  [R_Axial_DIN0207_L6.3mm_D2.5mm_P7.62mm_Horizontal]
R64  100k  R  [R_Axial_DIN0207_L6.3mm_D2.5mm_P7.62mm_Horizontal]
R65  100k  R  [R_Axial_DIN0207_L6.3mm_D2.5mm_P7.62mm_Horizontal]
R66  100k  R  [R_Axial_DIN0207_L6.3mm_D2.5mm_P7.62mm_Horizontal]
R67  100k  R  [R_Axial_DIN0207_L6.3mm_D2.5mm_P7.62mm_Horizontal]
R68  100k  R  [R_Axial_DIN0207_L6.3mm_D2.5mm_P7.62mm_Horizontal]
R69  100  R  [R_Axial_DIN0207_L6.3mm_D2.5mm_P7.62mm_Horizontal]
RV1  20k  POT  [Potentiometer_Bourns_3296W_Vertical]
RV2  100k  POT  [Potentiometer_Bourns_3296W_Vertical]
RV3  200  POT  [Potentiometer_Bourns_3296W_Vertical]
RV4  200  POT  [Potentiometer_Bourns_3296W_Vertical]
RV5  200k  POT  [Potentiometer_Bourns_3296W_Vertical]
RV6  200k  POT  [Potentiometer_Bourns_3296W_Vertical]
RV7  10k  POT  [Potentiometer_Bourns_3296W_Vertical]
RV8  200  POT  [Potentiometer_Bourns_3296W_Vertical]
RV9  200  POT  [Potentiometer_Bourns_3296W_Vertical]
RV10  200k  POT  [Potentiometer_Bourns_3296W_Vertical]
RV11  200k  POT  [Potentiometer_Bourns_3296W_Vertical]
RV12  10k  POT  [Potentiometer_Bourns_3296W_Vertical]
RV13  200  POT  [Potentiometer_Bourns_3296W_Vertical]
RV14  200  POT  [Potentiometer_Bourns_3296W_Vertical]
RV15  200k  POT  [Potentiometer_Bourns_3296W_Vertical]
RV16  200k  POT  [Potentiometer_Bourns_3296W_Vertical]
RV17  10k  POT  [Potentiometer_Bourns_3296W_Vertical]
RV18  200  POT  [Potentiometer_Bourns_3296W_Vertical]
RV19  200  POT  [Potentiometer_Bourns_3296W_Vertical]
RV20  200k  POT  [Potentiometer_Bourns_3296W_Vertical]
RV21  200k  POT  [Potentiometer_Bourns_3296W_Vertical]
RV22  10k  POT  [Potentiometer_Bourns_3296W_Vertical]
TP1  CLOCK_2K  TP  [TestPoint_THTPad_D1.5mm_Drill0.7mm]
TP2  SQ  TP  [TestPoint_THTPad_D1.5mm_Drill0.7mm]
TP3  SQ_INV  TP  [TestPoint_THTPad_D1.5mm_Drill0.7mm]
TP4  H1_BPF2  TP  [TestPoint_THTPad_D1.5mm_Drill0.7mm]
TP5  H1_AP2  TP  [TestPoint_THTPad_D1.5mm_Drill0.7mm]
TP6  H1_OUT  TP  [TestPoint_THTPad_D1.5mm_Drill0.7mm]
TP7  H3_BPF2  TP  [TestPoint_THTPad_D1.5mm_Drill0.7mm]
TP8  H3_AP2  TP  [TestPoint_THTPad_D1.5mm_Drill0.7mm]
TP9  H3_OUT  TP  [TestPoint_THTPad_D1.5mm_Drill0.7mm]
TP10  H5_BPF2  TP  [TestPoint_THTPad_D1.5mm_Drill0.7mm]
TP11  H5_AP2  TP  [TestPoint_THTPad_D1.5mm_Drill0.7mm]
TP12  H5_OUT  TP  [TestPoint_THTPad_D1.5mm_Drill0.7mm]
TP13  H7_BPF2  TP  [TestPoint_THTPad_D1.5mm_Drill0.7mm]
TP14  H7_AP2  TP  [TestPoint_THTPad_D1.5mm_Drill0.7mm]
TP15  H7_OUT  TP  [TestPoint_THTPad_D1.5mm_Drill0.7mm]
TP16  SUM_RAW  TP  [TestPoint_THTPad_D1.5mm_Drill0.7mm]
TP17  OUT  TP  [TestPoint_THTPad_D1.5mm_Drill0.7mm]
TP18  GND  TP  [TestPoint_THTPad_D1.5mm_Drill0.7mm]
U1  NE555P  NE555  [DIP-8_W7.62mm]
U2  CD4013BE  4013  [DIP-14_W7.62mm]
U3  TL082CP  TL082  [DIP-8_W7.62mm]
U4  TL082CP  TL082  [DIP-8_W7.62mm]
U5  TL082CP  TL082  [DIP-8_W7.62mm]
U6  TL082CP  TL082  [DIP-8_W7.62mm]
U7  TL082CP  TL082  [DIP-8_W7.62mm]
U8  TL082CP  TL082  [DIP-8_W7.62mm]
U9  TL082CP  TL082  [DIP-8_W7.62mm]
U10  TL082CP  TL082  [DIP-8_W7.62mm]
U11  TL082CP  TL082  [DIP-8_W7.62mm]
U12  TL082CP  TL082  [DIP-8_W7.62mm]
U13  TL082CP  TL082  [DIP-8_W7.62mm]
U14  TL082CP  TL082  [DIP-8_W7.62mm]
U15  TL082CP  TL082  [DIP-8_W7.62mm]
U16  TL082CP  TL082  [DIP-8_W7.62mm]

## Nets
AC_SQUARE: C3.2 R3.1 RV2.1
CLOCK_2K: TP1.1 U1.3 U2.3
CTRL: C2.1 U1.5
D_FEEDBACK: U2.2 U2.5
DIGITAL_1K: C3.1 U2.1
DISCHARGE: R1.2 R2.1 U1.7
FREQ_R: R2.2 RV1.1
GND: C1.2 C2.2 C8.2 C9.2 C14.2 C15.2 C20.2 C21.2 C26.2 C27.2 C28.2 C29.1 C30.2 C31.2 C32.2 C33.1 C34.2 C35.1 C36.2 C37.1 C38.2 C39.1 C40.2 C41.1 C42.2 C43.1 C44.2 C45.1 C46.2 C47.1 C48.2 C49.1 C50.2 C51.1 C52.2 C53.1 C54.2 C55.1 C56.2 C57.1 C58.2 C59.1 J5.2 J6.2 R3.2 RV2.3 RV3.2 RV3.3 RV4.2 RV4.3 RV7.3 RV8.2 RV8.3 RV9.2 RV9.3 RV12.3 RV13.2 RV13.3 RV14.2 RV14.3 RV17.3 RV18.2 RV18.3 RV19.2 RV19.3 RV22.3 TP18.1 U1.1 U2.4 U2.6 U2.7 U2.8 U2.9 U2.11 U3.5 U4.3 U4.5 U6.3 U7.3 U7.5 U9.3 U10.3 U10.5 U12.3 U13.3 U13.5 U15.3 U16.3 U16.5
H1_AMPLITUDE: RV7.2 U6.5
H1_AP1: R13.1 R15.1 R17.1 U5.1
H1_AP2: J1.1 R16.1 R18.1 TP5.1 U5.7
H1_APINV1: R12.2 R13.2 U5.2
H1_APINV2: R15.2 R16.2 U5.6
H1_BPF1: C4.2 R8.1 R9.1 U4.1
H1_BPF2: C6.2 R11.1 R12.1 R14.1 TP4.1 U4.7
H1_INV1: C5.2 R8.2 U4.2
H1_INV2: C7.2 R11.2 U4.6
H1_LP1: C8.1 RV5.2 RV5.3 U5.3
H1_LP2: C9.1 RV6.2 RV6.3 U5.5
H1_NEG: J1.3 R19.1 U6.1
H1_NODE1: C4.1 C5.1 R6.2 R7.1
H1_NODE2: C6.1 C7.1 R9.2 R10.1
H1_OUT: R62.1 TP6.1 U6.6 U6.7
H1_PHR1: R14.2 RV5.1
H1_PHR2: R17.2 RV6.1
H1_POLINV: R18.2 R19.2 U6.2
H1_SELECT: J1.2 RV7.1
H1_TUNE1: R7.2 RV3.1
H1_TUNE2: R10.2 RV4.1
H3_AMPLITUDE: RV12.2 U9.5
H3_AP1: R27.1 R29.1 R31.1 U8.1
H3_AP2: J2.1 R30.1 R32.1 TP8.1 U8.7
H3_APINV1: R26.2 R27.2 U8.2
H3_APINV2: R29.2 R30.2 U8.6
H3_BPF1: C10.2 R22.1 R23.1 U7.1
H3_BPF2: C12.2 R25.1 R26.1 R28.1 TP7.1 U7.7
H3_INV1: C11.2 R22.2 U7.2
H3_INV2: C13.2 R25.2 U7.6
H3_LP1: C14.1 RV10.2 RV10.3 U8.3
H3_LP2: C15.1 RV11.2 RV11.3 U8.5
H3_NEG: J2.3 R33.1 U9.1
H3_NODE1: C10.1 C11.1 R20.2 R21.1
H3_NODE2: C12.1 C13.1 R23.2 R24.1
H3_OUT: R63.1 TP9.1 U9.6 U9.7
H3_PHR1: R28.2 RV10.1
H3_PHR2: R31.2 RV11.1
H3_POLINV: R32.2 R33.2 U9.2
H3_SELECT: J2.2 RV12.1
H3_TUNE1: R21.2 RV8.1
H3_TUNE2: R24.2 RV9.1
H5_AMPLITUDE: RV17.2 U12.5
H5_AP1: R41.1 R43.1 R45.1 U11.1
H5_AP2: J3.1 R44.1 R46.1 TP11.1 U11.7
H5_APINV1: R40.2 R41.2 U11.2
H5_APINV2: R43.2 R44.2 U11.6
H5_BPF1: C16.2 R36.1 R37.1 U10.1
H5_BPF2: C18.2 R39.1 R40.1 R42.1 TP10.1 U10.7
H5_INV1: C17.2 R36.2 U10.2
H5_INV2: C19.2 R39.2 U10.6
H5_LP1: C20.1 RV15.2 RV15.3 U11.3
H5_LP2: C21.1 RV16.2 RV16.3 U11.5
H5_NEG: J3.3 R47.1 U12.1
H5_NODE1: C16.1 C17.1 R34.2 R35.1
H5_NODE2: C18.1 C19.1 R37.2 R38.1
H5_OUT: R64.1 TP12.1 U12.6 U12.7
H5_PHR1: R42.2 RV15.1
H5_PHR2: R45.2 RV16.1
H5_POLINV: R46.2 R47.2 U12.2
H5_SELECT: J3.2 RV17.1
H5_TUNE1: R35.2 RV13.1
H5_TUNE2: R38.2 RV14.1
H7_AMPLITUDE: RV22.2 U15.5
H7_AP1: R55.1 R57.1 R59.1 U14.1
H7_AP2: J4.1 R58.1 R60.1 TP14.1 U14.7
H7_APINV1: R54.2 R55.2 U14.2
H7_APINV2: R57.2 R58.2 U14.6
H7_BPF1: C22.2 R50.1 R51.1 U13.1
H7_BPF2: C24.2 R53.1 R54.1 R56.1 TP13.1 U13.7
H7_INV1: C23.2 R50.2 U13.2
H7_INV2: C25.2 R53.2 U13.6
H7_LP1: C26.1 RV20.2 RV20.3 U14.3
H7_LP2: C27.1 RV21.2 RV21.3 U14.5
H7_NEG: J4.3 R61.1 U15.1
H7_NODE1: C22.1 C23.1 R48.2 R49.1
H7_NODE2: C24.1 C25.1 R51.2 R52.1
H7_OUT: R65.1 TP15.1 U15.6 U15.7
H7_PHR1: R56.2 RV20.1
H7_PHR2: R59.2 RV21.1
H7_POLINV: R60.2 R61.2 U15.2
H7_SELECT: J4.2 RV22.1
H7_TUNE1: R49.2 RV18.1
H7_TUNE2: R52.2 RV19.1
OUT: J6.1 R69.2 TP17.1
RESTORE_INV: R67.2 R68.2 U16.6
SOURCE_WIPER: RV2.2 U3.3
SQ: R4.1 R6.1 R20.1 R34.1 R48.1 TP2.1 U3.1 U3.2
SQ_INV: R5.1 TP3.1 U3.7
SQ_INV_IN: R4.2 R5.2 U3.6
SUM_INV: R62.2 R63.2 R64.2 R65.2 R66.2 U16.2
SUM_NEG: R66.1 R67.1 U16.1
SUM_RAW: R68.1 R69.1 TP16.1 U16.7
TIMING: C1.1 RV1.2 RV1.3 U1.2 U1.6
VCC: C28.1 C30.1 C31.1 C32.1 C34.1 C36.1 C38.1 C40.1 C42.1 C44.1 C46.1 C48.1 C50.1 C52.1 C54.1 C56.1 C58.1 J5.1 R1.1 U1.4 U1.8 U2.10 U2.14 U3.8 U4.8 U5.8 U6.8 U7.8 U8.8 U9.8 U10.8 U11.8 U12.8 U13.8 U14.8 U15.8 U16.8
VEE: C29.2 C33.2 C35.2 C37.2 C39.2 C41.2 C43.2 C45.2 C47.2 C49.2 C51.2 C53.2 C55.2 C57.2 C59.2 J5.3 U3.4 U4.4 U5.4 U6.4 U7.4 U8.4 U9.4 U10.4 U11.4 U12.4 U13.4 U14.4 U15.4 U16.4
Unconnected: U2.12 U2.13

## Notes on the sheet
- NE555 + TL082 FOURIER WAVEFORM SYNTHESIS — Rev B wired schematic
- Regulated +12 V / GND / -12 V. Signal wires are drawn explicitly. All labels are single-sheet local nets.
- SOURCE: 2 kHz clock / divide by two / DC blocking / 10 Vpp calibration
- REGULATED +/-12 V INPUT
- C29 positive terminal = GND
- 1 kHz: TWO MFB BANDPASS SECTIONS -> TWO ALL-PASS SECTIONS -> POLARITY -> AMPLITUDE
- ONE shunt: default 2-3
- 3 kHz: TWO MFB BANDPASS SECTIONS -> TWO ALL-PASS SECTIONS -> POLARITY -> AMPLITUDE
- ONE shunt: default 2-3
- 5 kHz: TWO MFB BANDPASS SECTIONS -> TWO ALL-PASS SECTIONS -> POLARITY -> AMPLITUDE
- ONE shunt: default 2-3
- 7 kHz: TWO MFB BANDPASS SECTIONS -> TWO ALL-PASS SECTIONS -> POLARITY -> AMPLITUDE
- SUM AND OUTPUT
- ONE shunt: default 2-3
- ANALOG POWER AND LOCAL BYPASS: 100 nF at each supply pin

## Library data of the parts
C1 C2 C4-C27 C30-C59 = Waveform:C
C3 C28 C29 = Waveform:CP
J1-J5 = Waveform:CONN3
J6 = Waveform:CONN2
R1-R69 = Waveform:R
RV1-RV22 = Waveform:POT
TP1-TP18 = Waveform:TP
U1 = Waveform:NE555
U2 = Waveform:4013
U3-U16 = Waveform:TL082

## Net classes
0 default: width 0.25 mm, drill 0.3 mm, clearance 0.2 mm